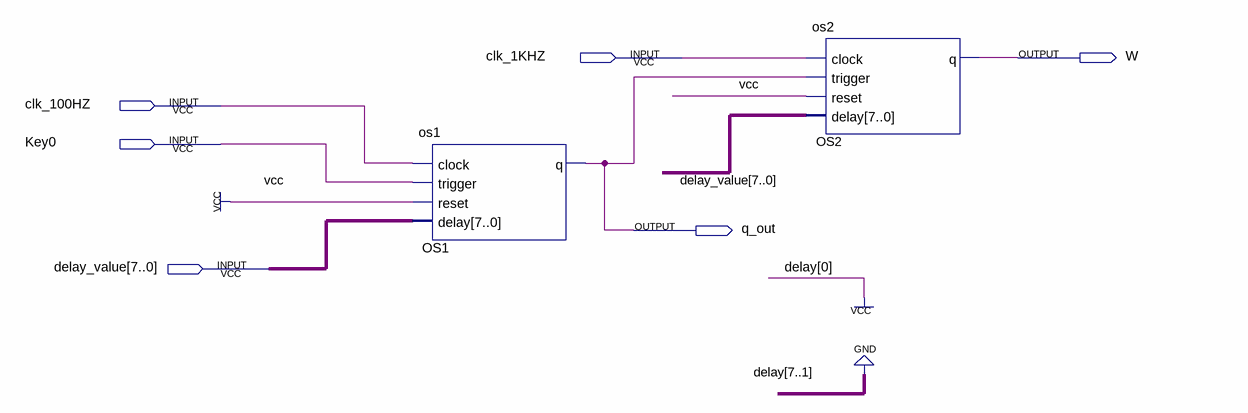
[diagram p0: schematic sheet]
// Quartus schematic w_signal_trigger_circuit.bdf as structural Verilog: 2 symbols, 6 pins
module w_signal_trigger_circuit (
  input  clk_1KHZ,
  input  clk_100HZ,
  input  Key0,
  input  [7:0] delay_value,
  output W,
  output q_out
);

  os1 OS1 (.clock(clk_100HZ), .trigger(Key0), .reset(1'b1), .delay(delay_value), .q(q_out));
  os2 OS2 (.clock(clk_1KHZ), .trigger(q_out), .reset(1'b1), .delay(delay_value), .q(W));
endmodule
